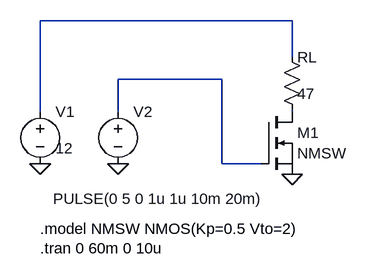
[diagram p0: schematic Ex09.asc]
Ex09.asc, the LTspice schematic file:
Version 4
SHEET 1 880 680
WIRE 60 200 60 60
WIRE 60 60 448 60
WIRE 448 60 448 116
WIRE 448 196 448 200
WIRE 180 200 180 150
WIRE 180 150 340 150
WIRE 340 150 340 280
WIRE 340 280 400 280
FLAG 60 280 0
FLAG 180 280 0
FLAG 448 296 0
SYMBOL voltage 60 184 R0
WINDOW 0 24 16 Left 2
WINDOW 3 24 72 Left 2
SYMATTR InstName V1
SYMATTR Value 12
SYMBOL voltage 180 184 R0
WINDOW 0 24 16 Left 2
WINDOW 3 -100 150 Left 2
SYMATTR InstName V2
SYMATTR Value PULSE(0 5 0 1u 1u 10m 20m)
SYMBOL res 432 100 R0
WINDOW 0 24 16 Left 2
WINDOW 3 24 72 Left 2
SYMATTR InstName RL
SYMATTR Value 47
SYMBOL nmos 400 200 R0
WINDOW 0 56 32 Left 2
WINDOW 3 56 64 Left 2
SYMATTR InstName M1
SYMATTR Value NMSW
TEXT 60 380 Left 2 !.model NMSW NMOS(Kp=0.5 Vto=2)
TEXT 60 410 Left 2 !.tran 0 60m 0 10u

The netlist it stands for:
* Ex09.asc
V1 N001 0 12
V2 N003 0 PULSE(0 5 0 1u 1u 10m 20m)
RL N001 N002 47
M1 N002 N003 0 0 NMSW
.model NMOS NMOS
.model PMOS PMOS
.lib standard.mos
.model NMSW NMOS(Kp=0.5 Vto=2)
.tran 0 60m 0 10u
.backanno
.end